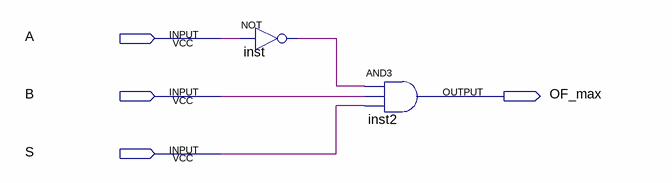
[diagram p0: schematic sheet]
// Quartus schematic OF_max.bdf as structural Verilog: 2 symbols, 4 pins
module OF_max (
  input  A,
  input  B,
  input  S,
  output OF_max
);

  wire inst_out;

  not inst (inst_out, A);
  and inst2 (OF_max, inst_out, B, S);
endmodule
